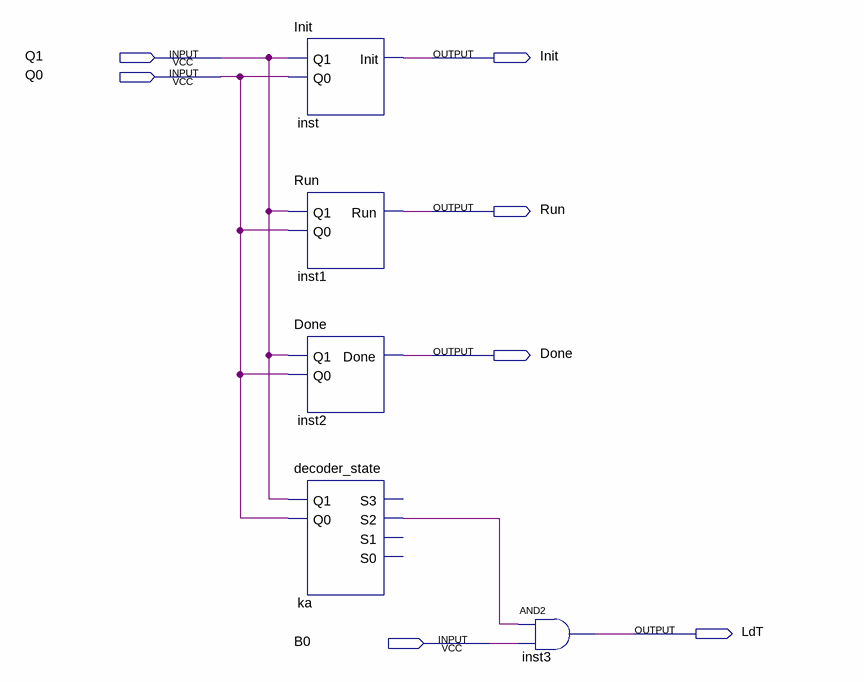
[diagram p0: schematic sheet]
// Quartus schematic output_logic.bdf as structural Verilog: 5 symbols, 7 pins
module output_logic (
  input  Q1,
  input  Q0,
  input  B0,
  output Init,
  output Run,
  output Done,
  output LdT
);

  wire ka_s2;

  Init inst (.Q1(Q1), .Q0(Q0), .Init(Init));
  Run inst1 (.Q1(Q1), .Q0(Q0), .Run(Run));
  Done inst2 (.Q1(Q1), .Q0(Q0), .Done(Done));
  decoder_state ka (.Q1(Q1), .Q0(Q0), .S2(ka_s2));  // open: S3, S1, S0
  and inst3 (LdT, ka_s2, B0);
endmodule
